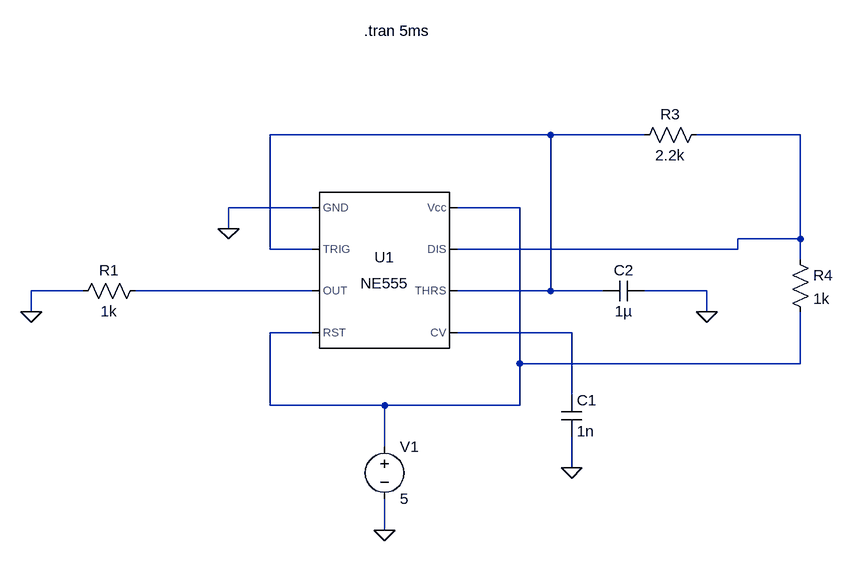
[diagram p0: schematic 555PWM.asc]
555PWM.asc, the LTspice schematic file:
Version 4
SHEET 1 1156 772
WIRE 704 144 272 144
WIRE 848 144 704 144
WIRE 1088 144 928 144
WIRE 336 256 208 256
WIRE 656 256 560 256
WIRE 208 288 208 256
WIRE 1088 304 1088 144
WIRE 1088 304 992 304
WIRE 272 320 272 144
WIRE 336 320 272 320
WIRE 992 320 992 304
WIRE 992 320 560 320
WIRE 1088 336 1088 304
WIRE -16 384 -96 384
WIRE 336 384 64 384
WIRE 704 384 704 144
WIRE 704 384 560 384
WIRE 784 384 704 384
WIRE 944 384 848 384
WIRE -96 416 -96 384
WIRE 944 416 944 384
WIRE 336 448 272 448
WIRE 736 448 560 448
WIRE 656 496 656 256
WIRE 1088 496 1088 416
WIRE 1088 496 656 496
WIRE 736 544 736 448
WIRE 272 560 272 448
WIRE 448 560 272 560
WIRE 656 560 656 496
WIRE 656 560 448 560
WIRE 448 624 448 560
WIRE 736 656 736 608
WIRE 448 752 448 704
FLAG 448 752 0
FLAG 208 288 0
FLAG 736 656 0
FLAG -96 416 0
FLAG 944 416 0
SYMBOL Misc/NE555 448 352 R0
SYMATTR InstName U1
SYMBOL Voltage 448 608 R0
SYMATTR InstName V1
SYMATTR Value 5
SYMBOL Cap 720 544 R0
SYMATTR InstName C1
SYMATTR Value 1n
SYMBOL Res 80 368 R90
WINDOW 0 0 56 VBottom 2
WINDOW 3 32 56 VTop 2
SYMATTR InstName R1
SYMATTR Value 1k
SYMBOL Cap 848 368 R90
WINDOW 0 0 32 VBottom 2
WINDOW 3 32 32 VTop 2
SYMATTR InstName C2
SYMATTR Value 1µ
SYMBOL Res 944 128 R90
WINDOW 0 0 56 VBottom 2
WINDOW 3 32 56 VTop 2
SYMATTR InstName R3
SYMATTR Value 2.2k
SYMBOL Res 1072 320 R0
SYMATTR InstName R4
SYMATTR Value 1k
TEXT 416 -16 Left 2 !.tran 5ms

The netlist it stands for:
* 555PWM.asc
XU1 0 N001 N004 N003 N005 N001 N002 N003 NE555  ; pins GND TRIG OUT RST CV THRS DIS Vcc
V1 N003 0 5
C1 N005 0 1n
R1 N004 0 1k
C2 0 N001 1µ
R3 N002 N001 2.2k
R4 N002 N003 1k
.tran 5ms
.lib NE555.sub
.backanno
.end